# Altium schematic sheet 10_Sensor.SchDoc
size 386 x 325 mm; DsnPath: C:\Users\nilot\Documents\VSCode\SBC\imports\SG2002_QFN88_38_20230301_4L_V1.3_16.2.DSN; SchematicName: CV181xC_QFN88_38_DemoBoard; PageName: 10_Sensor; PageSize: Custom; TopSchematic: True
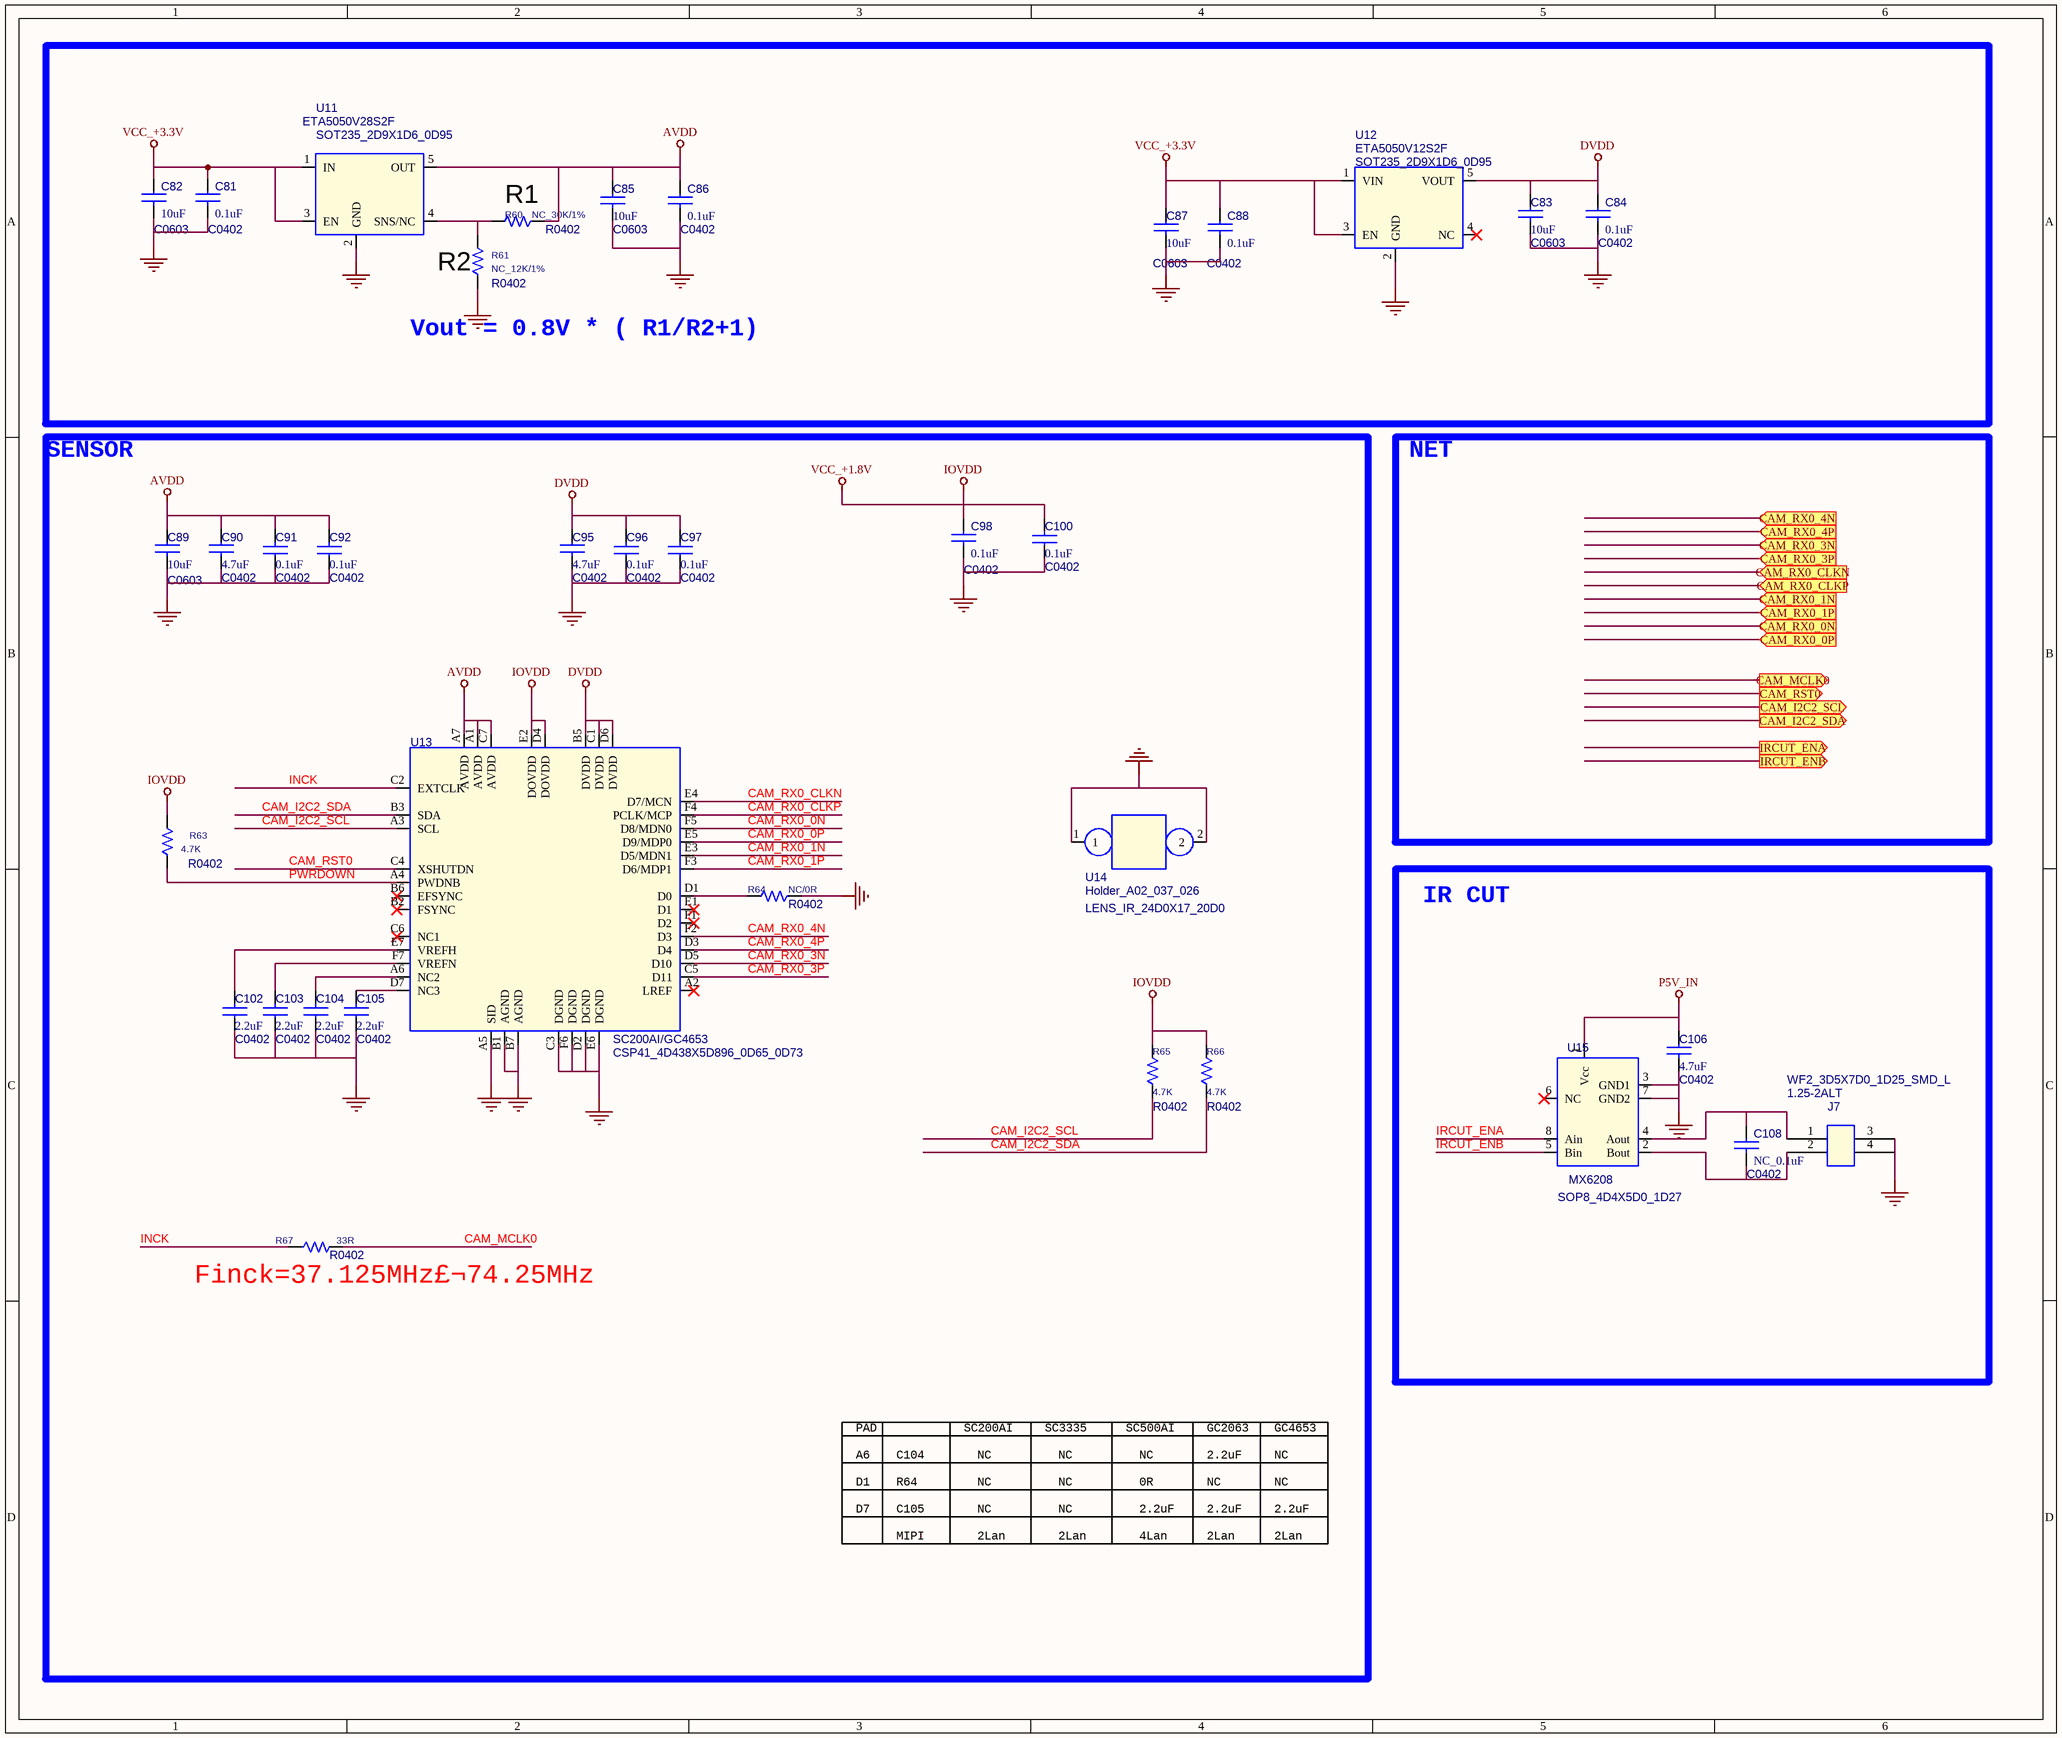
[diagram p0: 10_Sensor.SchDoc]

## Parts
C81  0.1uF  [C0402]
C82  10uF  [C0603]
C83  10uF  [C0603]
C84  0.1uF  [C0402]
C85  10uF  [C0603]
C86  0.1uF  [C0402]
C87  10uF  [C0603]
C88  0.1uF  [C0402]
C89  10uF  [C0603]
C90  4.7uF  [C0402]
C91  0.1uF  [C0402]
C92  0.1uF  [C0402]
C95  4.7uF  [C0402]
C96  0.1uF  [C0402]
C97  0.1uF  [C0402]
C98  0.1uF  [C0402]
C100  0.1uF  [C0402]
C102  2.2uF  [C0402]
C103  2.2uF  [C0402]
C104  2.2uF  [C0402]
C105  2.2uF  [C0402]
C106  4.7uF  [C0402]
C108  NC_0.1uF  [C0402]
J7  1.25-2ALT  [WF2_3D5X7D0_1D25_SMD_L]
R60  NC_30K/1%  [R0402]
R61  NC_12K/1%  [R0402]
R63  4.7K  [R0402]
R64  NC/0R  [R0402]
R65  4.7K  [R0402]
R66  4.7K  [R0402]
R67  33R  [R0402]
U11  ETA5050V28S2F  [SOT235_2D9X1D6_0D95]
U12  ETA5050V12S2F  [SOT235_2D9X1D6_0D95]
U13  SC200AI/GC4653  [CSP41_4D438X5D896_0D65_0D73]
U14  Holder_A02_037_026  [LENS_IR_24D0X17_20D0]
U15  MX6208  [SOP8_4D4X5D0_1D27]

## Blocks framed on the sheet
Finck=37.125MHz£¬74.25MHz: C89-C92 C95-C98 C100 C102-C105 R63-R67 U13 U14
IR CUT: C106 C108 J7 U15

## Ports
CAM_I2C2_SCL (out), CAM_I2C2_SDA (out), CAM_MCLK0 (out), CAM_RST0 (out), CAM_RX0_0N (in), CAM_RX0_0P (in), CAM_RX0_1N (in), CAM_RX0_1P (in), CAM_RX0_3N (in), CAM_RX0_3P (in), CAM_RX0_4N (in), CAM_RX0_4P (in), CAM_RX0_CLKN (in), CAM_RX0_CLKP (in), IRCUT_ENA (out), IRCUT_ENB (out)

## Nets
AVDD: C85.1 C86.1 C89.1 C90.1 C91.2 C92.2 R60.1 U11.5(OUT) U13.A1(AVDD) U13.A7(AVDD) U13.C7(AVDD)
DVDD: C83.1 C84.1 C95.1 C96.2 C97.2 U12.5(VOUT) U13.B5(DVDD) U13.C1(DVDD) U13.D6(DVDD)
GND: C81.2 C82.2 C83.2 C84.2 C85.2 C86.2 C87.2 C88.2 C89.2 C90.2 C91.1 C92.1 C95.2 C96.1 C97.1 C98.2 C100.1 C102.1 C103.1 C104.1 C105.1 C106.2 J7.3 J7.4 R61.1 R64.1 U11.2(GND) U12.2(GND) U13.A5(SID) U13.B1(AGND) U13.B7(AGND) U13.C3(DGND) U13.D2(DGND) U13.E6(DGND) U13.F6(DGND) U14.1 U14.2 U15.3(GND1) U15.7(GND2)
IOVDD: C98.1 C100.2 R63.2 R65.2 R66.2 U13.D4(DOVDD) U13.E2(DOVDD)  [also labelled VCC_+1.8V]
P5V_IN: C106.1 U15.1(Vcc)
VCC_+3.3V: C81.1 C82.1 C87.1 C88.1 U11.1(IN) U11.3(EN) U12.1(VIN) U12.3(EN)
CAM_I2C2_SCL: R65.1 U13.A3(SCL)
CAM_I2C2_SDA: R66.1 U13.B3(SDA)
CAM_MCLK0: R67.2
CAM_RST0: U13.C4(XSHUTDN)
CAM_RX0_0N: U13.F5(D8/MDN0)
CAM_RX0_0P: U13.E5(D9/MDP0)
CAM_RX0_1N: U13.E3(D5/MDN1)
CAM_RX0_1P: U13.F3(D6/MDP1)
CAM_RX0_3N: U13.D5(D10)
CAM_RX0_3P: U13.C5(D11)
CAM_RX0_4N: U13.F2(D3)
CAM_RX0_4P: U13.D3(D4)
CAM_RX0_CLKN: U13.E4(D7/MCN)
CAM_RX0_CLKP: U13.F4(PCLK/MCP)
INCK: R67.1 U13.C2(EXTCLK)
IRCUT_ENA: U15.8(Ain)
IRCUT_ENB: U15.5(Bin)
PWRDOWN: R63.1 U13.A4(PWDNB)
NetC102_2: C102.2 U13.E7(VREFH)
NetC103_2: C103.2 U13.F7(VREFN)
NetC104_2: C104.2 U13.A6(NC2)
NetC105_2: C105.2 U13.D7(NC3)
NetC108_1: C108.1 J7.1 U15.4(Aout)
NetC108_2: C108.2 J7.2 U15.2(Bout)
NetR60_2: R60.2 R61.2 U11.4(SNS/NC)
NetR64_2: R64.2 U13.D1(D0)

Not connected (* = marked no-connect by the designer): U12 4(NC)*; U13 A2(LREF)* B2(FSYNC)* B6(EFSYNC)* C6(NC1)* E1(D1)* F1(D2)*; U15 6(NC)*

## Notes on the sheet
- (near R60) R1
- R2
- (near R61) Vout = 0.8V * ( R1/R2+1)
- SENSOR
- NET
- A6
- D1
- PAD
- C104
- R64
- SC200AI
- NC
- SC3335
- SC500AI
- 0R
- GC2063
- 2.2uF
- GC4653
- D7
- C105
- MIPI
- 2Lan
- 4Lan

## Library data of the parts
C81 = C: CAP CER 0.1UF 16V 10% X7R 0402; Part Name: sC0402; Part Number: GRM155R61E104KA87D; Part Reference: C81; Cloud IC Number: Y02110431K00; Vendor: murata; Value: 0.1uF; PCB Footprint: C0402
C82 = C: 22UF,16V,10%,X5R,0805; Part Name: sC0402; Part Number: GRM155R61E104KA87D; Part Reference: C82; Cloud IC Number: Y02110431K00; Vendor: murata; Value: 10uF; PCB Footprint: C0603
C83 = C: ÌùÆ¬µçÈÝ CAP CER 0.1UF 16V 10% X7R 0402; Part Name: sC0402; Part Number: 20400087; Part Reference: C83; Cloud IC Number: Y02110431K00; Vendor: murata; Value: 10uF; PCB Footprint: C0603
C84 = C: CAP CER 0.1UF 16V 10% X7R 0402; Part Name: sC0402; Part Number: GRM155R61E104KA87D; Part Reference: C84; Cloud IC Number: Y02110431K00; Vendor: murata; Value: 0.1uF; PCB Footprint: C0402
C85 = C: ÌùÆ¬µçÈÝ CAP CER 0.1UF 16V 10% X7R 0402; Part Name: sC0402; Part Number: 20400087; Part Reference: C85; Cloud IC Number: Y02110431K00; Vendor: murata; Value: 10uF; PCB Footprint: C0603
C86 = C: CAP CER 0.1UF 16V 10% X7R 0402; Part Name: sC0402; Part Number: GRM155R61E104KA87D; Part Reference: C86; Cloud IC Number: Y02110431K00; Vendor: murata; Value: 0.1uF; PCB Footprint: C0402
C87 = C: ÌùÆ¬µçÈÝ CAP CER 0.1UF 16V 10% X7R 0402; Part Name: sC0402; Part Number: 20400087; Part Reference: C87; Cloud IC Number: Y02110431K00; Vendor: murata; Value: 10uF; PCB Footprint: C0603
C88 = C: CAP CER 0.1UF 16V 10% X7R 0402; Part Name: sC0402; Part Number: GRM155R61E104KA87D; Part Reference: C88; Cloud IC Number: Y02110431K00; Vendor: murata; Value: 0.1uF; PCB Footprint: C0402
C89 = C: ÌùÆ¬µçÈÝ CAP CER 0.1UF 16V 10% X7R 0402; Part Name: sC0402; Part Number: 20400087; Part Reference: C89; Cloud IC Number: Y02110431K00; Vendor: murata; Value: 10uF; PCB Footprint: C0603
C90 = C: ÌùÆ¬µçÈÝ CAP CER 0.1UF 16V 10% X7R 0402; Part Name: sC0402; Part Number: 20400219; Part Reference: C90; Cloud IC Number: Y02110431K00; Vendor: murata; Value: 4.7uF; PCB Footprint: C0402
C91 = C: ÌùÆ¬µçÈÝ CAP CER 0.1UF 16V 10% X7R 0402; Part Name: sC0402; Part Number: 20400159; Part Reference: C91; Cloud IC Number: Y02110431K00; Vendor: murata; Value: 0.1uF; PCB Footprint: C0402
C92 = C: ÌùÆ¬µçÈÝ CAP CER 0.1UF 16V 10% X7R 0402; Part Name: sC0402; Part Number: 20400159; Part Reference: C92; Cloud IC Number: Y02110431K00; Vendor: murata; Value: 0.1uF; PCB Footprint: C0402
C95 = C: ÌùÆ¬µçÈÝ CAP CER 0.1UF 16V 10% X7R 0402; Part Name: sC0402; Part Number: 20400219; Part Reference: C95; Cloud IC Number: Y02110431K00; Vendor: murata; Value: 4.7uF; PCB Footprint: C0402
C96 = C: ÌùÆ¬µçÈÝ CAP CER 0.1UF 16V 10% X7R 0402; Part Name: sC0402; Part Number: 20400159; Part Reference: C96; Cloud IC Number: Y02110431K00; Vendor: murata; Value: 0.1uF; PCB Footprint: C0402
C97 = C: ÌùÆ¬µçÈÝ CAP CER 0.1UF 16V 10% X7R 0402; Part Name: sC0402; Part Number: 20400159; Part Reference: C97; Cloud IC Number: Y02110431K00; Vendor: murata; Value: 0.1uF; PCB Footprint: C0402
C98 = C: CAP CER 0.1UF 16V 10% X7R 0402; Part Name: sC0402; Part Number: GRM155R61E104KA87D; Part Reference: C98; Cloud IC Number: Y02110431K00; Vendor: murata; Value: 0.1uF; PCB Footprint: C0402
C100 = C: ÌùÆ¬µçÈÝ CAP CER 0.1UF 16V 10% X7R 0402; Part Name: sC0402; Part Number: 20400159; Part Reference: C100; Cloud IC Number: Y02110431K00; Vendor: murata; Value: 0.1uF; PCB Footprint: C0402
C102 = C: Cap, 1uF, +/-10%, 25V, X5R 0402; Part Name: sC0402; Part Number: GRM155R61E104KA87D; Part Reference: C102; Cloud IC Number: Y02110431K00; Vendor: murata; Value: 2.2uF; PCB Footprint: C0402
C103 = C: Cap, 1uF, +/-10%, 25V, X5R 0402; Part Name: sC0402; Part Number: GRM155R61E104KA87D; Part Reference: C103; Cloud IC Number: Y02110431K00; Vendor: murata; Value: 2.2uF; PCB Footprint: C0402
C104 = C: Cap, 1uF, +/-10%, 25V, X5R 0402; Part Name: sC0402; Part Number: GRM155R61E104KA87D; Part Reference: C104; Cloud IC Number: Y02110431K00; Vendor: murata; Value: 2.2uF; PCB Footprint: C0402
C105 = C: Cap, 1uF, +/-10%, 25V, X5R 0402; Part Name: sC0402; Part Number: GRM155R61E104KA87D; Part Reference: C105; Cloud IC Number: Y02110431K00; Vendor: murata; Value: 2.2uF; PCB Footprint: C0402
C106 = C: ÌùÆ¬µçÈÝ CAP CER 0.1UF 16V 10% X7R 0402; Part Name: sC0402; Part Reference: C106; Cloud IC Number: Y02110431K00; Vendor: murata; Value: 4.7uF; PCB Footprint: C0402
C108 = C: Cap, 1uF, +/-10%, 25V, X5R 0402; Part Name: sC0402; Part Number: GRM155R61E104KA87D; Part Reference: C108; Cloud IC Number: Y02110431K00; Vendor: murata; Value: NC_0.1uF; PCB Footprint: C0402
J7 = CON2_1: Part Reference: J7; Value: 1.25-2ALT; PCB Footprint: WF2_3D5X7D0_1D25_SMD_L
R60 = R_Dup1: RES SMD 680K OHM 1% 1/16W 0402; Part Reference: R60; Value: NC_30K/1%; PCB Footprint: R0402
R61 = R_Dup1: 130K,OHM,1%,1/16W,R0402(1005); Part Reference: R61; Value: NC_12K/1%; PCB Footprint: R0402
R63 = R_Dup2: Part Reference: R63; Value: 4.7K; PCB Footprint: R0402
R64 = R_Dup2: Part Reference: R64; Value: NC/0R; PCB Footprint: R0402
R65 = R_Dup2: Part Reference: R65; Part Number: 20200053; Value: 4.7K; PCB Footprint: R0402
R66 = R_Dup2: Part Reference: R66; Part Number: 20200053; Value: 4.7K; PCB Footprint: R0402
R67 = R_Dup2: Part Reference: R67; Value: 33R; PCB Footprint: R0402
U11 = LDO-PT5108/RT9013_2: Part Reference: U11; Value: ETA5050V28S2F; PCB Footprint: SOT235_2D9X1D6_0D95
U12 = G9091-180T11U: Part Reference: U12; Value: ETA5050V12S2F; PCB Footprint: SOT235_2D9X1D6_0D95
U13 = IMX327LQR-C_1: Part Reference: U13; Value: SC200AI/GC4653; PCB Footprint: CSP41_4D438X5D896_0D65_0D73
U14 = CAM_Holder: Part Reference: U14; Value: Holder_A02_037_026; PCB Footprint: LENS_IR_24D0X17_20D0
U15 = BA6208F_1: Part Reference: U15; Value: MX6208; PCB Footprint: SOP8_4D4X5D0_1D27